# Altium project Main_Board.PrjPcb (part 15 of 44)
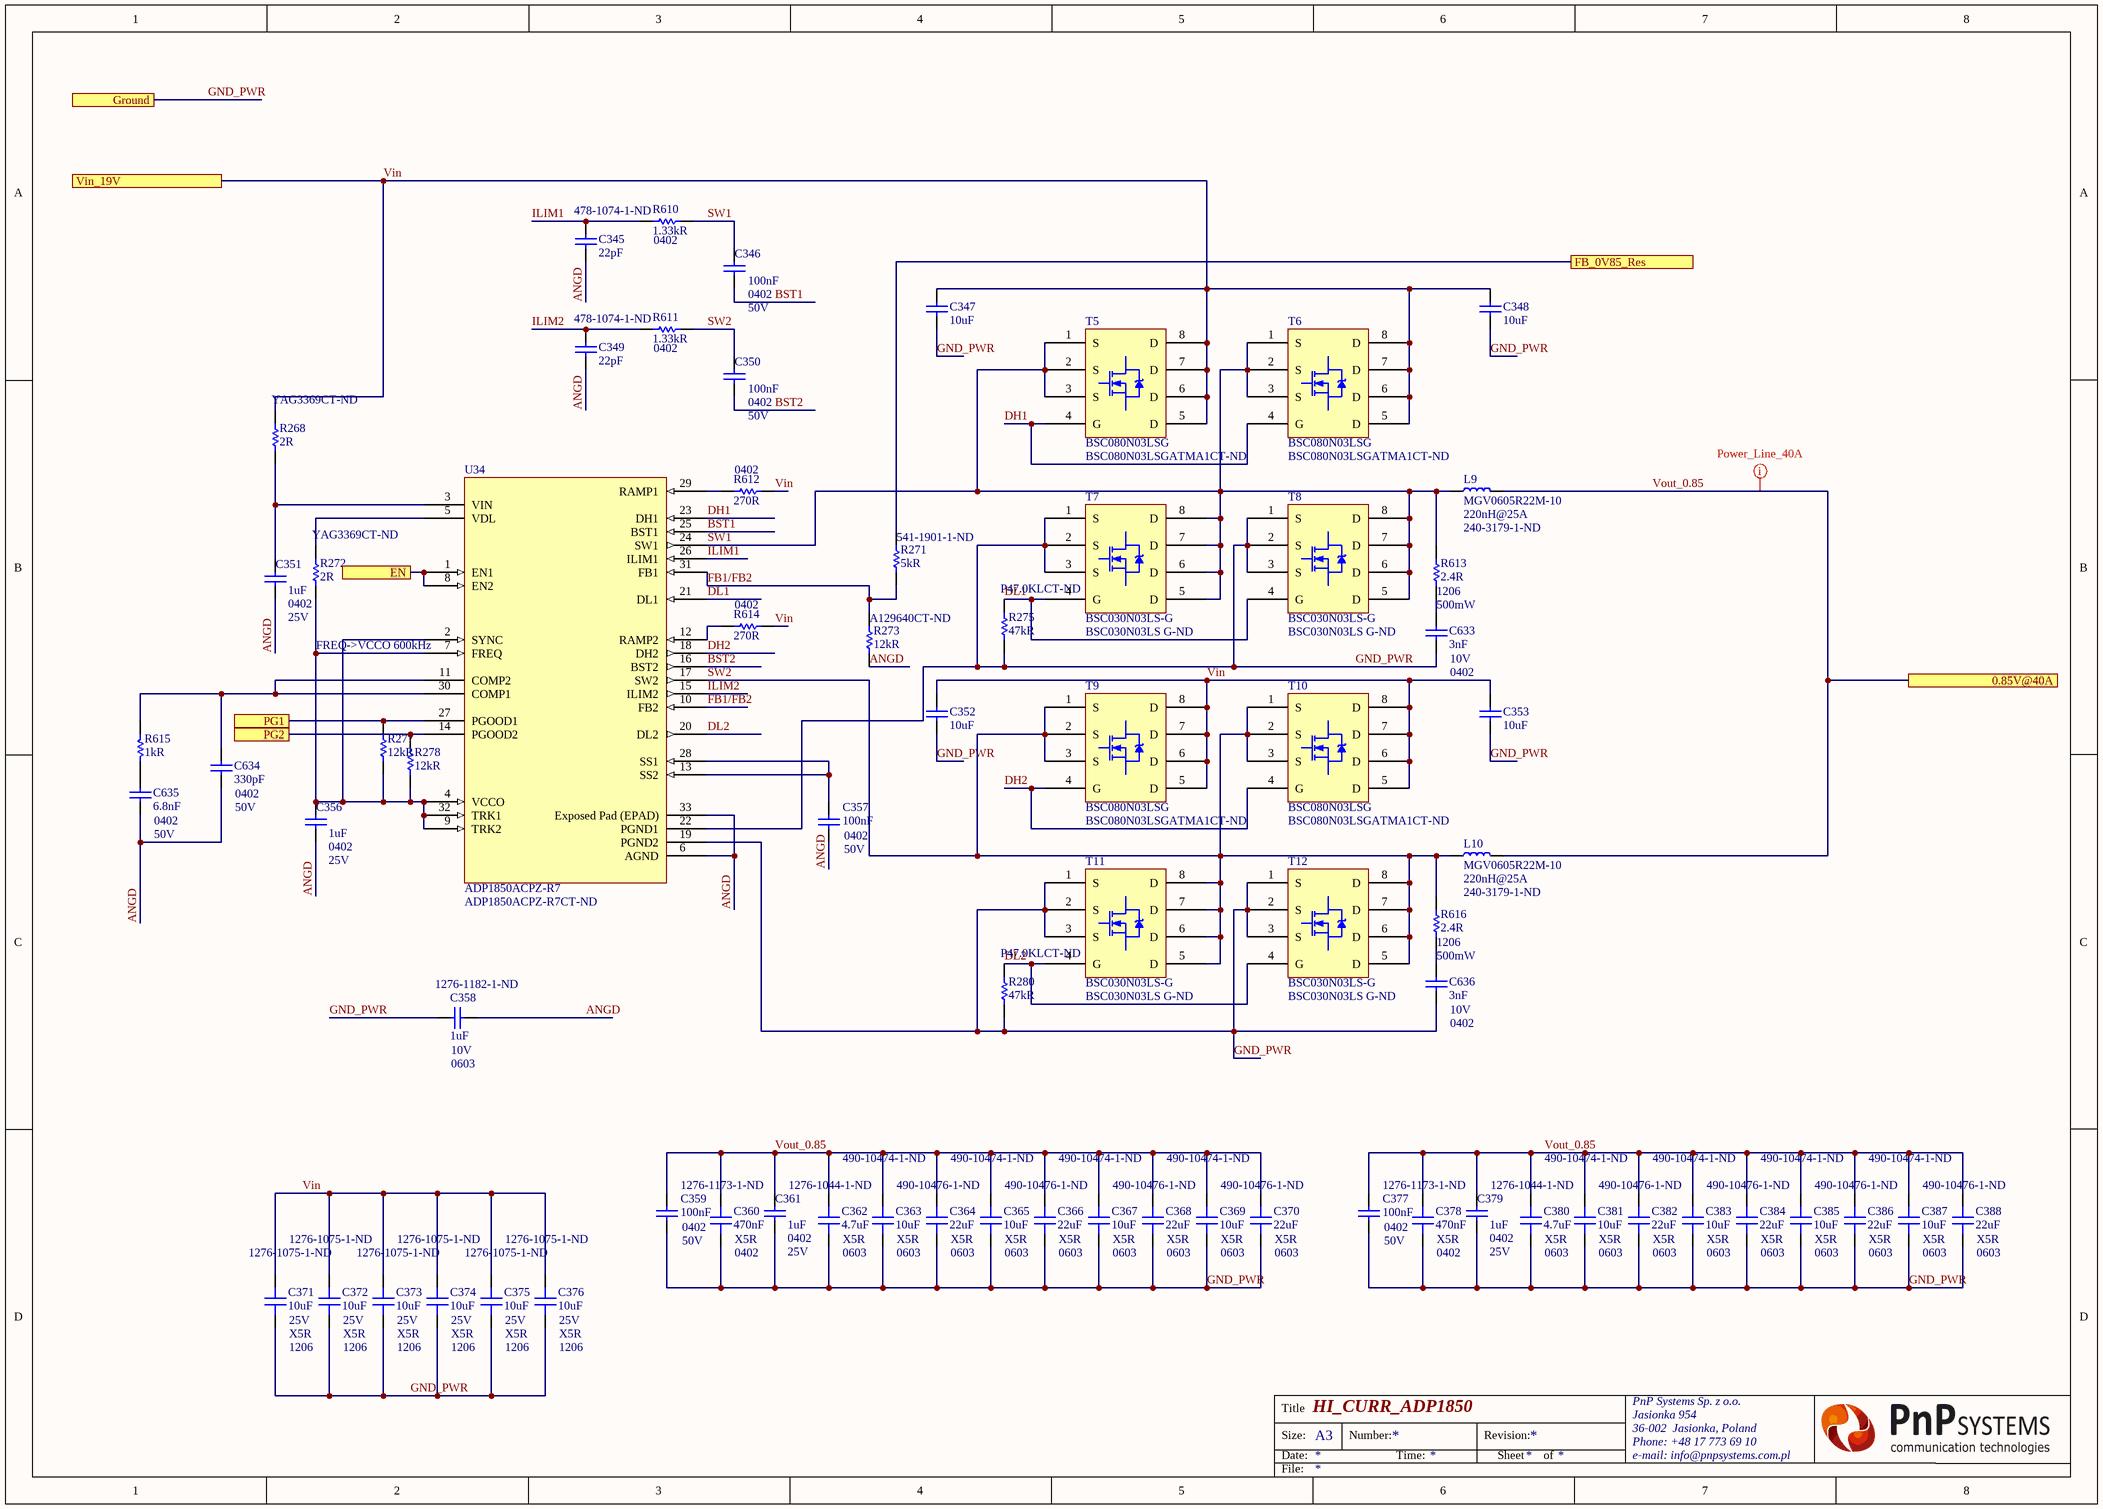
[diagram p126: HI_Curr_ADP1850.SchDoc]

## Sheet HI_Curr_ADP1850.SchDoc: HI_CURR_ADP1850 (continued)

### Library data of the parts
C345 C349 = Capacitor: Manufacturer: Kyocera AVX; Manufacturer Part Number: 04025A220JAT2A; Tolerance: 5%; Voltage Rating: 50V; Dielectric: C0G; Temperature Coefficient: 30ppm/°C; Supplier 1: Digi-Key; Stock 1: 1489814; Pricing 1: 1 = 0,10000, 10 = 0,03500, 100 = 0,01550, 500 = 0,01108, 1000 = 0,00871, 2500 = 0,00792, 5000 = 0,00729 (USD); RoHS: Yes; Mount: Surface Mount; Case/Package: 0402; Number of Pins: 2; Case Code (Metric): 1005; Case Code (Imperial): 0402; Contact Plating: Tin,Matte; Min Operating Temperature: -55°C; Max Operating Temperature: 125°C; Capacitance: 22pF; Packaging: Tape and Reel; Voltage Rating (DC): 50V; Package Quantity: 1; Termination: SMD/SMT; Voltage: 50V; Length: 1mm; Height: 0.5mm; Width: 0.02inch; Depth: 0.5mm; Thickness: 0.022inch; Radiation Hardening: No; Lead Free: Lead Free; REACH SVHC: No SVHC; ComponentLink1URL: https://datasheet.ciiva.com/11787/0900766b80def0e2-11787300.pdf?src-supplier=RSComponents; ComponentLink1Description: https://datasheet.ciiva.com/11787/0900766b80def0e2-11787300.pdf?src-supplier=RSComponents; ComponentLink2URL: https://datasheet.ciiva.com/39121/2009578-39121644.pdf?src-supplier=Jameco; ComponentLink2Description: https://datasheet.ciiva.com/39121/2009578-39121644.pdf?src-supplier=Jameco; ComponentLink3URL: https://datasheet.ciiva.com/1123/ccog-1123585.pdf?src-supplier=Element14; ComponentLink3Description: https://datasheet.ciiva.com/1123/ccog-1123585.pdf?src-supplier=Element14; ComponentLink4URL: https://datasheet.ciiva.com/1123/ccog-1123586.pdf?src-supplier=Element14; ComponentLink4Description: https://datasheet.ciiva.com/1123/ccog-1123586.pdf?src-supplier=Element14; ComponentLink5URL: https://datasheet.ciiva.com/150/ccog-150515.pdf?src-supplier=Digi-Key; ComponentLink5Description: https://datasheet.ciiva.com/150/ccog-150515.pdf?src-supplier=Digi-Key; ComponentLink6URL: https://datasheet.ciiva.com/150/ccog-150516.pdf?src-supplier=Digi-Key; ComponentLink6Description: https://datasheet.ciiva.com/150/ccog-150516.pdf?src-supplier=Digi-Key; ComponentLink7URL: https://datasheet.ciiva.com/150/ccog-150517.pdf?src-supplier=Digi-Key; ComponentLink7Description: https://datasheet.ciiva.com/150/ccog-150517.pdf?src-supplier=Digi-Key; ComponentLink8URL: https://datasheet.ciiva.com/2987/ccog-2987653.pdf?src-supplier=Avnet; ComponentLink8Description: https://datasheet.ciiva.com/2987/ccog-2987653.pdf?src-supplier=Avnet; ComponentLink9URL: https://datasheet.ciiva.com/2987/ccog-2987654.pdf?src-supplier=Avnet; ComponentLink9Description: https://datasheet.ciiva.com/2987/ccog-2987654.pdf?src-supplier=Avnet; ComponentLink10URL: https://datasheet.ciiva.com/5423/ccog-243403-5423927.pdf?src-supplier=Mouser; ComponentLink10Description: https://datasheet.ciiva.com/5423/ccog-243403-5423927.pdf?src-supplier=Mouser; ComponentLink11URL: https://datasheet.ciiva.com/16218/ccog-16218185.pdf?src-supplier=Future+Electronics; ComponentLink11Description: https://datasheet.ciiva.com/16218/ccog-16218185.pdf?src-supplier=Future+Electronics; ComponentLink12URL: https://datasheet.ciiva.com/28592/759117-28592746.pdf?src-supplier=Element14; ComponentLink12Description: https://datasheet.ciiva.com/28592/759117-28592746.pdf?src-supplier=Element14; ComponentLink13URL: https://datasheet.ciiva.com/15165/getdatasheetpartid-38041-15165131.pdf?src-supplier=Verical; ComponentLink13Description: https://datasheet.ciiva.com/15165/getdatasheetpartid-38041-15165131.pdf?src-supplier=Verical
C346 C350 C357 C359 C377 = Capacitor: CAP CER 0.1UF 50V X5R 0402; Manufacturer: Murata; Manufacturer Part Number: GRM155R61H104KE14D; Dielectric Material: Ceramic; Dissipation Factor: 0.025%; Tolerance: 10%; Supplier 1: Digi-Key; Supplier Part Number 1: 490-10697-1-ND; RoHS: Yes; Category: Ceramic Capacitors; Stock 1: 435607; Pricing 1: 1=0,10000, 10=0,04600, 100=0,02050, 500=0,01464, 1000=0,01150, 2500=0,01045, 5000=0,00961 (USD); Mount: Surface Mount; Case/Package: 0402; Weight: 0.000212oz; Case Code (Metric): 1005; Min Operating Temperature: -55°C; Max Operating Temperature: 85°C; Capacitance: 100nF; Packaging: Tape and Reel; Voltage Rating: 50V; Dielectric: X5R; Termination: SMD/SMT; Composition: Ceramic; Voltage Rating (DC): 50V; Package Quantity: 10000; Length: 1mm; Height: 0.5mm; Width: 0.02inch; Thickness: 0.022inch; Depth: 0.5mm; REACH SVHC: No SVHC; Lead Free: Lead Free; ComponentLink1URL: http://www.farnell.com/datasheets/2079150.pdf?src-supplier=Farnell; ComponentLink1Description: http://www.farnell.com/datasheets/2079150.pdf?src-supplier=Farnell; ComponentLink2URL: http://www.mouser.com/ds/2/281/c02e-2905.pdf?src-supplier=Mouser; ComponentLink2Description: http://www.mouser.com/ds/2/281/c02e-2905.pdf?src-supplier=Mouser; ComponentLink3URL: http://www.farnell.com/datasheets/2079150.pdf?src-supplier=Element14; ComponentLink3Description: http://www.farnell.com/datasheets/2079150.pdf?src-supplier=Element14; ComponentLink4URL: http://search.murata.co.jp/Ceramy/image/img/A01X/G101/ENG/GRM155R61H104KE14-01.pdf?src-supplier=Digi-Key; ComponentLink4Description: http://search.murata.co.jp/Ceramy/image/img/A01X/G101/ENG/GRM155R61H104KE14-01.pdf?src-supplier=Digi-Key
C347 C348 C352 C353 = Capacitor: Manufacturer 1: Murata; Manufacturer Part Number 1: GRM31CR71E106MA12L; Tolerance: 20%; Dielectric: X7R; Voltage Rating: 25V; Supplier 1: Digi-Key; Supplier Part Number 1: 490-6519-1-ND; Stock 1: 9864; Pricing 1: 1=0,79000, 10=0,59800, 100=0,42750, 500=0,33098, 1000=0,28501 (USD); RoHS: Yes; Mount: Surface Mount; Case/Package: 1206; Case Code (Metric): 3216; Case Code (Imperial): 1206; Min Operating Temperature: -55°C; Max Operating Temperature: 125°C; Capacitance: 10uF; Package Quantity: 1; Packaging: Tape and Reel; Termination: SMD/SMT; Voltage: 25V; Voltage Rating (DC): 25V; Length: 3.2mm; Height: 1.6mm; Width: 0.063inch; Thickness: 0.071inch; Depth: 1.6mm; Radiation Hardening: No; REACH SVHC: No SVHC; Lead Free: Lead Free; ComponentLink1URL: https://datasheet.ciiva.com/11607/product-11607561.pdf?src-supplier=Avnet; ComponentLink1Description: https://datasheet.ciiva.com/11607/product-11607561.pdf?src-supplier=Avnet; ComponentLink2URL: https://datasheet.ciiva.com/5412/product-5412861.pdf?src-supplier=Mouser; ComponentLink2Description: https://datasheet.ciiva.com/5412/product-5412861.pdf?src-supplier=Mouser; ComponentLink3URL: https://datasheet.ciiva.com/6264/partnumbering-e-01-6264463.pdf?src-supplier=Digi-Key; ComponentLink3Description: https://datasheet.ciiva.com/6264/partnumbering-e-01-6264463.pdf?src-supplier=Digi-Key
C351 C356 C361 C379 = Capacitor: as C331 on sheet Power_Hi_Curr; Supplier 1: Digi-Key; Supplier Part Number 1: 490-12263-1-ND; Manufacturer: Murata; Manufacturer Part Number: GRT155R61E105KE01D; RoHS: Yes; Category: Ceramic Capacitors; Stock 1: 341453; Pricing 1: 1=0,18000, 10=0,12300, 100=0,06210, 500=0,04248, 1000=0,03758, 2500=0,03594, 5000=0,03268 (USD); Mount: Surface Mount; Case Code (Metric): 1005; Case Code (Imperial): 0402; Min Operating Temperature: -55°C; Max Operating Temperature: 85°C; Packaging: Tape and Reel; Capacitance: 1uF; Tolerance: 10%; Dielectric: X5R; Voltage Rating (DC): 25V; Length: 0.039inch; Width: 0.02inch; Thickness: 0.022inch; Ratings: AEC-Q200; ComponentLink1URL: http://www.farnell.com/datasheets/2165918.pdf?src-supplier=Farnell; ComponentLink1Description: http://www.farnell.com/datasheets/2165918.pdf?src-supplier=Farnell; ComponentLink2URL: http://search.murata.co.jp/Ceramy/image/img/A01X/G101/ENG/GRT155R61E105KE01-01.pdf?src-supplier=Digi-Key; ComponentLink2Description: http://search.murata.co.jp/Ceramy/image/img/A01X/G101/ENG/GRT155R61E105KE01-01.pdf?src-supplier=Digi-Key; ComponentLink3URL: http://www.farnell.com/datasheets/2165918.pdf?src-supplier=Element14; ComponentLink3Description: http://www.farnell.com/datasheets/2165918.pdf?src-supplier=Element14
C358 = Capacitor: Cap Ceramic 1uF 10V X5R 10% SMD 0603 85C Paper T/R; Manufacturer: Samsung; Manufacturer Part Number: CL10A105KP8NNNC; Supplier 1: Digi-Key; RoHS: Yes; Category: Ceramic Capacitors; Stock 1: 3646234; Pricing 1: 1=0,10000, 10=0,03600, 100=0,01610, 500=0,01152, 1000=0,00905 (USD); Mount: Surface Mount; Case Code (Metric): 1608; Case Code (Imperial): 0603; Contact Plating: Tin; Min Operating Temperature: -55°C; Max Operating Temperature: 85°C; Tolerance: 10%; Packaging: Tape and Reel; Package Quantity: 1; Capacitance: 1uF; Dielectric: X5R; Voltage: 10V; Length: 1.6mm; Height: 0.8mm; Width: 0.031inch; Thickness: 0.035inch; Depth: 0.8mm; Radiation Hardening: No; ComponentLink1URL: https://datasheet.ciiva.com/15195/getdatasheetpartid-358616-15195708.pdf?src-supplier=Verical; ComponentLink1Description: https://datasheet.ciiva.com/15195/getdatasheetpartid-358616-15195708.pdf?src-supplier=Verical; ComponentLink2URL: https://datasheet.ciiva.com/16358/cl05b104kq5nnnc-16358431.pdf?src-supplier=Future+Electronics; ComponentLink2Description: https://datasheet.ciiva.com/16358/cl05b104kq5nnnc-16358431.pdf?src-supplier=Future+Electronics
C360 C378 = Capacitor: Manufacturer: Samsung; Manufacturer Part Number: CL05A474KP5NNNC; Tolerance: 10%; Voltage Rating: 10V; Supplier 1: Digi-Key; Stock 1: 941442; Pricing 1: 1 = 0,10000, 10 = 0,07000, 100 = 0,03140, 500 = 0,02240, 1000 = 0,01761, 2500 = 0,01600, 5000 = 0,01472 (USD); RoHS: Yes; Mount: Surface Mount; Case Code (Metric): 1005; Case Code (Imperial): 0402; Min Operating Temperature: -55°C; Max Operating Temperature: 85°C; Capacitance: 470nF; Packaging: Tape and Reel; Voltage Rating (DC): 10V; Length: 1mm; Height: 0.5mm; Width: 0.02inch; Thickness: 0.022inch; Depth: 0.5mm; Radiation Hardening: No; Lead Free: Lead Free; ComponentLink1URL: https://datasheet.ciiva.com/25710/cl05a474kp5nnnc-25710324.pdf?src-supplier=Digi-Key; ComponentLink1Description: https://datasheet.ciiva.com/25710/cl05a474kp5nnnc-25710324.pdf?src-supplier=Digi-Key; ComponentLink2URL: https://datasheet.ciiva.com/26838/getdatasheetpartid-355286-26838191.pdf?src-supplier=Verical; ComponentLink2Description: https://datasheet.ciiva.com/26838/getdatasheetpartid-355286-26838191.pdf?src-supplier=Verical; ComponentLink3URL: https://datasheet.ciiva.com/16437/cl05b104kq5nnnc-16437351.pdf?src-supplier=Future+Electronics; ComponentLink3Description: https://datasheet.ciiva.com/16437/cl05b104kq5nnnc-16437351.pdf?src-supplier=Future+Electronics
C362 C380 = Capacitor: Manufacturer: Samsung; Manufacturer Part Number: CL10A475KP8NNNC; Tolerance: 10%; Voltage Rating: 10V; Supplier 1: Digi-Key; Stock 1: 2124648; Pricing 1: 1 = 0,13000, 10 = 0,09600, 100 = 0,04520, 500 = 0,03168, 1000 = 0,02622 (USD); RoHS: Yes; Mount: Surface Mount; Case Code (Metric): 1608; Case Code (Imperial): 0603; Contact Plating: Tin; Min Operating Temperature: -55°C; Max Operating Temperature: 85°C; Capacitance: 4.7uF; Package Quantity: 1; Packaging: Tape and Reel; Length: 1.6mm; Height: 0.8mm; Width: 0.031inch; Thickness: 0.035inch; Depth: 0.8mm; Radiation Hardening: No; ComponentLink1URL: https://datasheet.ciiva.com/25797/cl10a475kp8nnnc-25797520.pdf?src-supplier=Digi-Key; ComponentLink1Description: https://datasheet.ciiva.com/25797/cl10a475kp8nnnc-25797520.pdf?src-supplier=Digi-Key; ComponentLink2URL: https://datasheet.ciiva.com/26838/getdatasheetpartid-358676-26838384.pdf?src-supplier=Verical; ComponentLink2Description: https://datasheet.ciiva.com/26838/getdatasheetpartid-358676-26838384.pdf?src-supplier=Verical; ComponentLink3URL: https://datasheet.ciiva.com/16318/cl05b104kq5nnnc-16318245.pdf?src-supplier=Future+Electronics; ComponentLink3Description: https://datasheet.ciiva.com/16318/cl05b104kq5nnnc-16318245.pdf?src-supplier=Future+Electronics
C363 C365 C367 C369 C381 C383 C385 C387 = Capacitor: Manufacturer: Murata; Manufacturer Part Number: GRM188R61A106KE69D; Tolerance: 10%; Voltage Rating: 10V; Supplier 1: Digi-Key; Stock 1: 4597169; Pricing 1: 1 = 0,21000, 10 = 0,14000, 100 = 0,07110, 500 = 0,04864, 1000 = 0,04303 (USD); RoHS: Yes; Mount: Surface Mount; Case Code (Metric): 1608; Case Code (Imperial): 0603; Min Operating Temperature: -55°C; Max Operating Temperature: 85°C; Capacitance: 10uF; Packaging: Tape and Reel; Voltage: 10V; Voltage Rating (DC): 10V; Length: 1.6mm; Height: 0.8mm; Width: 0.031inch; Thickness: 0.037inch; Depth: 0.8mm; REACH SVHC: No SVHC; Lead Free: Lead Free; ComponentLink1URL: http://components.arrow.com/part/dataview/0323_07281717?src-supplier=Arrow+Europe; ComponentLink1Description: http://components.arrow.com/part/dataview/0323_07281717?src-supplier=Arrow+Europe; ComponentLink2URL: http://www.farnell.com/datasheets/1955682.pdf?src-supplier=Farnell; ComponentLink2Description: http://www.farnell.com/datasheets/1955682.pdf?src-supplier=Farnell; ComponentLink3URL: http://www.mouser.com/ds/2/281/c02e-2905.pdf?src-supplier=Mouser; ComponentLink3Description: http://www.mouser.com/ds/2/281/c02e-2905.pdf?src-supplier=Mouser; ComponentLink4URL: http://search.murata.co.jp/Ceramy/image/img/A01X/G101/ENG/GRM188R61A106KE69-01.pdf?src-supplier=Digi-Key; ComponentLink4Description: http://search.murata.co.jp/Ceramy/image/img/A01X/G101/ENG/GRM188R61A106KE69-01.pdf?src-supplier=Digi-Key; ComponentLink5URL: http://www.farnell.com/datasheets/1955682.pdf?src-supplier=Element14; ComponentLink5Description: http://www.farnell.com/datasheets/1955682.pdf?src-supplier=Element14; ComponentLink6URL: http://www.farnell.com/datasheets/1955682.pdf?src-supplier=Newark; ComponentLink6Description: http://www.farnell.com/datasheets/1955682.pdf?src-supplier=Newark; ComponentLink7URL: http://psearch.en.murata.com/capacitor/product/GRM188R61A106KE69%23.pdf?src-supplier=Avnet; ComponentLink7Description: http://psearch.en.murata.com/capacitor/product/GRM188R61A106KE69%23.pdf?src-supplier=Avnet
C364 C366 C368 C370 C382 C384 C386 C388 = Capacitor: Manufacturer: Murata; Manufacturer Part Number: GRM188R61A226ME15D; Material: Ceramic; Tolerance: 20%; Voltage Rating: 10V; Supplier 1: Digi-Key; Stock 1: 1768748; Pricing 1: 1 = 0,31000, 10 = 0,21500, 100 = 0,12160, 500 = 0,08584, 1000 = 0,07512 (USD); RoHS: Yes; Mount: Surface Mount; Weight: 0.000222oz; Case Code (Metric): 1608; Case Code (Imperial): 0603; Min Operating Temperature: -55°C; Max Operating Temperature: 85°C; Capacitance: 22uF; Packaging: Tape and Reel; Termination: SMD/SMT; Voltage Rating (DC): 10V; Package Quantity: 4000; Length: 1.6mm; Height: 0.8mm; Width: 0.8mm; Thickness: 0.039inch; Depth: 0.8mm; REACH SVHC: No SVHC; Lead Free: Lead Free; ComponentLink1URL: https://datasheet.ciiva.com/46444/1769893-46444975.pdf?src-supplier=Element14; ComponentLink1Description: https://datasheet.ciiva.com/46444/1769893-46444975.pdf?src-supplier=Element14
C371-C376 = Capacitor: Cap Ceramic 10uF 25V X5R 10% SMD 1206 85C Embossed T/R; Manufacturer: Samsung; Manufacturer Part Number: CL31A106KAHNNNE; Supplier 1: Digi-Key; RoHS: Yes; Category: Ceramic Capacitors; Stock 1: 791813; Pricing 1: 1=0,22000, 10=0,15000, 100=0,07600, 500=0,05200, 1000=0,04600 (USD); Mount: Surface Mount; Case Code (Metric): 3216; Case Code (Imperial): 1206; Material: Ceramic; Contact Plating: Tin; Min Operating Temperature: -55°C; Max Operating Temperature: 85°C; Tolerance: 10%; Capacitance: 10uF; Voltage Rating (DC): 25V; Packaging: Tape and Reel; Voltage Rating: 25V; Length: 3.2mm; Height: 1.6mm; Depth: 1.6mm; Width: 0.063inch; Thickness: 0.071inch; Radiation Hardening: No; Lead Free: Lead Free; ComponentLink1URL: https://datasheet.ciiva.com/25710/cl31a106kahnnne-25710837.pdf?src-supplier=Digi-Key; ComponentLink1Description: https://datasheet.ciiva.com/25710/cl31a106kahnnne-25710837.pdf?src-supplier=Digi-Key; ComponentLink2URL: https://datasheet.ciiva.com/15195/getdatasheetpartid-355210-15195990.pdf?src-supplier=Verical; ComponentLink2Description: https://datasheet.ciiva.com/15195/getdatasheetpartid-355210-15195990.pdf?src-supplier=Verical; ComponentLink3URL: https://datasheet.ciiva.com/29201/452519-da-01-en-vs-kondensator-1206-29201124.pdf?src-supplier=Conrad; ComponentLink3Description: https://datasheet.ciiva.com/29201/452519-da-01-en-vs-kondensator-1206-29201124.pdf?src-supplier=Conrad
C633 C636 = Capacitor: Manufacturer: Murata; Manufacturer Part Number: GRM1557U1A302JA01D; Tolerance: 5%; Dielectric: U2J; Supplier 1: Digi-Key; Supplier Part Number 1: 490-8243-1-ND; Stock 1: 13189; Pricing 1: 1 = 0,22000, 10 = 0,14700, 100 = 0,07450, 500 = 0,05100, 1000 = 0,04511, 2500 = 0,04315, 5000 = 0,03923 (USD); RoHS: Yes; Mount: Surface Mount; Case/Package: 0402; Case Code (Metric): 1005; Min Operating Temperature: -55°C; Max Operating Temperature: 125°C; Capacitance: 3nF; Packaging: Tape and Reel; Voltage Rating (DC): 10V; Package Quantity: 10000; Termination: SMD/SMT; Length: 1mm; Height: 0.5mm; Width: 0.5mm; Thickness: 0.022inch; Depth: 0.5mm; Radiation Hardening: No; Lead Free: Lead Free; ComponentLink1URL: https://datasheet.ciiva.com/11620/product-11620441.pdf?src-supplier=Avnet; ComponentLink1Description: https://datasheet.ciiva.com/11620/product-11620441.pdf?src-supplier=Avnet; ComponentLink2URL: https://datasheet.ciiva.com/29542/partnumbering-e-01-29542685.pdf?src-supplier=Digi-Key; ComponentLink2Description: https://datasheet.ciiva.com/29542/partnumbering-e-01-29542685.pdf?src-supplier=Digi-Key; ComponentLink3URL: https://datasheet.ciiva.com/29542/partnumbering-e-01-29542686.pdf?src-supplier=Digi-Key; ComponentLink3Description: https://datasheet.ciiva.com/29542/partnumbering-e-01-29542686.pdf?src-supplier=Digi-Key; ComponentLink4URL: https://datasheet.ciiva.com/29542/partnumbering-e-01-29542687.pdf?src-supplier=Digi-Key; ComponentLink4Description: https://datasheet.ciiva.com/29542/partnumbering-e-01-29542687.pdf?src-supplier=Digi-Key
C634 = Capacitor: Manufacturer: Yageo; Manufacturer Part Number: CC0402KRX7R9BB331; Dielectric Material: Ceramic; Tolerance: 10%; Dielectric: X7R; Insulation Resistance: 100GR; Supplier 1: Digi-Key; Supplier Part Number 1: 311-1027-1-ND; Stock 1: 223776; Pricing 1: 1 = 0,10000, 10 = 0,03000, 100 = 0,01350, 500 = 0,00966, 1000 = 0,00759, 2500 = 0,00690, 5000 = 0,00635 (USD); RoHS: Yes; Mount: Surface Mount; Case/Package: 0402; Case Code (Metric): 1005; Min Operating Temperature: -55°C; Max Operating Temperature: 125°C; Capacitance: 330pF; Packaging: Tape and Reel; Voltage Rating (DC): 50V; Package Quantity: 1; Termination: SMD/SMT; Composition: Ceramic; Length: 1mm; Height: 0.5mm; Width: 0.5mm; Thickness: 0.022inch; Depth: 0.5mm; Radiation Hardening: No; REACH SVHC: No SVHC; Lead Free: Lead Free; Halogen Free: Halogen Free; ComponentLink1URL: https://datasheet.ciiva.com/143/mlccorderingcode-143965.pdf?src-supplier=Digi-Key; ComponentLink1Description: https://datasheet.ciiva.com/143/mlccorderingcode-143965.pdf?src-supplier=Digi-Key; ComponentLink2URL: https://datasheet.ciiva.com/143/mlccorderingcode-143966.pdf?src-supplier=Digi-Key; ComponentLink2Description: https://datasheet.ciiva.com/143/mlccorderingcode-143966.pdf?src-supplier=Digi-Key; ComponentLink3URL: https://datasheet.ciiva.com/143/mlccorderingcode-143967.pdf?src-supplier=Digi-Key; ComponentLink3Description: https://datasheet.ciiva.com/143/mlccorderingcode-143967.pdf?src-supplier=Digi-Key; ComponentLink4URL: https://datasheet.ciiva.com/7978/1489800-7978101.pdf?src-supplier=Element14; ComponentLink4Description: https://datasheet.ciiva.com/7978/1489800-7978101.pdf?src-supplier=Element14; ComponentLink5URL: https://datasheet.ciiva.com/5425/upy-gphc-x7r-6-3v-to-50v-8-5425451.pdf?src-supplier=Mouser; ComponentLink5Description: https://datasheet.ciiva.com/5425/upy-gphc-x7r-6-3v-to-50v-8-5425451.pdf?src-supplier=Mouser; ComponentLink6URL: https://datasheet.ciiva.com/8033/1489800-8033628.pdf?src-supplier=Element14; ComponentLink6Description: https://datasheet.ciiva.com/8033/1489800-8033628.pdf?src-supplier=Element14; ComponentLink7URL: https://datasheet.ciiva.com/11464/upy-gphc-x7r-6-3v-to-50v-8-11464908.pdf?src-supplier=Avnet; ComponentLink7Description: https://datasheet.ciiva.com/11464/upy-gphc-x7r-6-3v-to-50v-8-11464908.pdf?src-supplier=Avnet; ComponentLink8URL: https://datasheet.ciiva.com/46394/1489800-46394572.pdf?src-supplier=Element14; ComponentLink8Description: https://datasheet.ciiva.com/46394/1489800-46394572.pdf?src-supplier=Element14; ComponentLink9URL: https://datasheet.ciiva.com/8033/1489800-8033629.pdf?src-supplier=Element14; ComponentLink9Description: https://datasheet.ciiva.com/8033/1489800-8033629.pdf?src-supplier=Element14
C635 = Capacitor: Manufacturer: Yageo; Manufacturer Part Number: CC0402KRX7R9BB682; Tolerance: 10%; Dielectric: X7R; Supplier 1: Digi-Key; Supplier Part Number 1: 311-1726-1-ND; Stock 1: 116423; Pricing 1: 1 = 0,10000, 10 = 0,03000, 100 = 0,01350, 500 = 0,00966, 1000 = 0,00759, 2500 = 0,00690, 5000 = 0,00635 (USD); RoHS: Yes; Mount: Surface Mount; Case/Package: 0402; Number of Pins: 2; Weight: 2.3E-05oz; Case Code (Metric): 1005; Min Operating Temperature: -55°C; Max Operating Temperature: 125°C; Capacitance: 6.8nF; Packaging: Tape and Reel; Voltage Rating: 50V; Voltage Rating (DC): 50V; Termination: SMD/SMT; Composition: Ceramic; Length: 1mm; Height: 0.5mm; Width: 0.02inch; Thickness: 0.022inch; Depth: 0.5mm; Radiation Hardening: No; Lead Free: Lead Free; Halogen Free: Halogen Free; ComponentLink1URL: https://datasheet.ciiva.com/11786/0900766b8079c870-11786013.pdf?src-supplier=RSComponents; ComponentLink1Description: https://datasheet.ciiva.com/11786/0900766b8079c870-11786013.pdf?src-supplier=RSComponents; ComponentLink2URL: https://datasheet.ciiva.com/17437/upy-gphc-x7r-6-3v-to-50v-8-17437372.pdf?src-supplier=Avnet+Europe; ComponentLink2Description: https://datasheet.ciiva.com/17437/upy-gphc-x7r-6-3v-to-50v-8-17437372.pdf?src-supplier=Avnet+Europe; ComponentLink3URL: https://datasheet.ciiva.com/11466/upy-gphc-x7r-6-3v-to-50v-8-11466414.pdf?src-supplier=Avnet; ComponentLink3Description: https://datasheet.ciiva.com/11466/upy-gphc-x7r-6-3v-to-50v-8-11466414.pdf?src-supplier=Avnet; ComponentLink4URL: https://datasheet.ciiva.com/13208/upy-gphc-x7r-6-3v-to-50v-8-12304-13208543.pdf?src-supplier=Mouser; ComponentLink4Description: https://datasheet.ciiva.com/13208/upy-gphc-x7r-6-3v-to-50v-8-12304-13208543.pdf?src-supplier=Mouser
L9 L10 = MGV0605R22M-10: 220nH Shielded Molded Inductor 25A 1.9mOhm Max Nonstandard; Manufacturer 1: Laird; Supplier 1: Digi-Key; Manufacturer Part Number 1: MGV0605R22M-10; Stock 1: 1560; Pricing 1: 1=0,92000, 10=0,85800, 100=0,62020 (USD); RoHS: No; ComponentLink1Description: Datasheet MGV0605 Series; ComponentLink1URL: https://assets.lairdtech.com/home/brandworld/files/MGV0605%20series%20approve%20sheet.pdf
R268 R272 = Resistor: Manufacturer 1: Yageo; Manufacturer Part Number 1: RC0402FR-072RL; Power Rating: 63mW; Tolerance: 1%; Voltage Rating: 50V; Temperature Coefficient: 200ppm/°C; Supplier 1: Digi-Key; Stock 1: 417064; Pricing 1: 1=0,10000, 10=0,02400, 100=0,00970, 1000=0,00435, 2500=0,00377, 5000=0,00312 (USD); RoHS: Yes; Case/Package: 0402; Case Code (Imperial): 0402; Case Code (Metric): 1005; Contact Plating: Tin,Matte; Min Operating Temperature: -55°C; Max Operating Temperature: 155°C; Resistance: 2R; Packaging: Tape and Reel; Composition: Thick Film; Termination: SMD/SMT; Number of Terminations: 2; Military Standard: Not; Max Power Dissipation: 63mW; Voltage Rating (DC): 50V; Features: Moisture Resistant; Length: 1mm; Height: 0.016inch; Width: 0.02inch; Depth: 0.5mm; REACH SVHC: Unknown; Lead Free: Lead Free; ComponentLink1URL: https://datasheet.ciiva.com/11808/0900766b80c66297-11808785.pdf?src-supplier=RSComponents; ComponentLink1Description: https://datasheet.ciiva.com/11808/0900766b80c66297-11808785.pdf?src-supplier=RSComponents; ComponentLink2URL: https://datasheet.ciiva.com/16868/pyu-rc0402-51-rohs-l-6-16868438.pdf?src-supplier=Avnet+Europe; ComponentLink2Description: https://datasheet.ciiva.com/16868/pyu-rc0402-51-rohs-l-6-16868438.pdf?src-supplier=Avnet+Europe; ComponentLink3URL: https://datasheet.ciiva.com/5596/pyu-rc0402-51-rohs-l-6-r-5596055.pdf?src-supplier=Mouser; ComponentLink3Description: https://datasheet.ciiva.com/5596/pyu-rc0402-51-rohs-l-6-r-5596055.pdf?src-supplier=Mouser; ComponentLink4URL: https://datasheet.ciiva.com/28415/pyu-rc0402-51-rohs-l-6-28415608.pdf?src-supplier=Avnet+Europe; ComponentLink4Description: https://datasheet.ciiva.com/28415/pyu-rc0402-51-rohs-l-6-28415608.pdf?src-supplier=Avnet+Europe; ComponentLink5URL: https://datasheet.ciiva.com/8894/pyu-rc0402-51-rohs-l-6-8894730.pdf?src-supplier=Avnet; ComponentLink5Description: https://datasheet.ciiva.com/8894/pyu-rc0402-51-rohs-l-6-8894730.pdf?src-supplier=Avnet; ComponentLink6URL: https://datasheet.ciiva.com/7849/1018594-7849950.pdf?src-supplier=Element14; ComponentLink6Description: https://datasheet.ciiva.com/7849/1018594-7849950.pdf?src-supplier=Element14; ComponentLink7URL: https://datasheet.ciiva.com/7849/1018594-7849951.pdf?src-supplier=Element14; ComponentLink7Description: https://datasheet.ciiva.com/7849/1018594-7849951.pdf?src-supplier=Element14
R271 = Resistor: RES SMD 5K OHM 0.1% 1/20W 0402; Manufacturer: Vishay Dale; Manufacturer Part Number: PNM0402E5001BST1; Max Power Dissipation: 50mW; Temperature Coefficient: 25ppm/°C; Supplier 1: Digi-Key; RoHS: Yes; Category: Chip SMD Resistors; Stock 1: 32246; Pricing 1: 1=1,08000, 10=0,95500, 100=0,69300 (USD); Case/Package: 0402; Case Code (Metric): 1005; Case Code (Imperial): 0402; Min Operating Temperature: -55°C; Max Operating Temperature: 155°C; Resistance: 5kR; Tolerance: 0.1%; Package Quantity: 1000; Packaging: Tape and Reel; Composition: Thin Film; Number of Terminations: 2; Features: Moisture Resistant,Anti-Sulfur; Length: 0.042inch; Height: 0.033inch; Width: 0.022inch; ComponentLink1URL: https://datasheet.ciiva.com/29717/pnm-29717416.pdf?src-supplier=Digi-Key; ComponentLink1Description: https://datasheet.ciiva.com/29717/pnm-29717416.pdf?src-supplier=Digi-Key; ComponentLink2URL: https://datasheet.ciiva.com/29717/pnm-29717417.pdf?src-supplier=Digi-Key; ComponentLink2Description: https://datasheet.ciiva.com/29717/pnm-29717417.pdf?src-supplier=Digi-Key; ComponentLink3URL: https://datasheet.ciiva.com/29717/pnm-29717418.pdf?src-supplier=Digi-Key; ComponentLink3Description: https://datasheet.ciiva.com/29717/pnm-29717418.pdf?src-supplier=Digi-Key
R273 R277 R278 = Resistor: CRGCQ 0402 12K 1%; Manufacturer: TE Connectivity; Manufacturer Part Number: CRGCQ0402F12K; Supplier 1: Digi-Key; RoHS: No; Stock 1: 103306; Pricing 1: 1=0,10000, 10=0,02100, 100=0,00860, 1000=0,00387, 2500=0,00336, 5000=0,00277 (USD); ComponentLink1URL: https://www.te.com/commerce/DocumentDelivery/DDEController?Action=srchrtrv&DocNm=1773204-3&DocType=DS&DocLang=English&src-supplier=Digi-Key; ComponentLink1Description: https://www.te.com/commerce/DocumentDelivery/DDEController?Action=srchrtrv&DocNm=1773204-3&DocType=DS&DocLang=English&src-supplier=Digi-Key; ComponentLink2URL: http://www.te.com/commerce/DocumentDelivery/DDEController?Action=srchrtrv&DocNm=1773204-3&DocType=DS&DocLang=English&src-supplier=Digi-Key; ComponentLink2Description: http://www.te.com/commerce/DocumentDelivery/DDEController?Action=srchrtrv&DocNm=1773204-3&DocType=DS&DocLang=English&src-supplier=Digi-Key; Resistance: 12kR
  R277 R278: Supplier Part Number 1: A129640CT-ND
R275 R280 = Resistor: PANASONIC - ERJ2RKF4702X - SMD Chip Resistor, 0402 [1005 Metric], 47 kohm, ERJ2R Series, 50 V, Thick Film, 100 mW; Manufacturer Part Number: ERJ-2RKF4702X; Voltage Rating: 50V; Power Rating: 100mW; Tolerance: 1%; Temperature Coefficient: 100ppm/°C; Supplier 1: Digi-Key; Manufacturer: Panasonic; RoHS: Yes; Category: Chip SMD Resistors; Stock 1: 1709999; Pricing 1: 1=0,10000, 10=0,04500, 100=0,01830, 1000=0,00822, 2500=0,00713, 5000=0,00589 (USD); Mount: Surface Mount; Case/Package: 0402; Number of Pins: 2; Case Code (Imperial): 0402; Case Code (Metric): 1005; Contact Plating: Tin; Min Operating Temperature: -55°C; Max Operating Temperature: 155°C; Packaging: Tape and Reel; Resistance: 47kR; Package Quantity: 1; Termination: SMD/SMT; Composition: Thick Film; Number of Terminations: 2; Military Standard: Not; Max Power Dissipation: 100mW; Voltage Rating (DC): 50V; Features: Automotive AEC-Q200; Length: 1mm; Height: 0.35mm; Width: 0.5mm; Depth: 0.5mm; Radiation Hardening: No; REACH SVHC: No SVHC; Lead Free: Lead Free; ComponentLink1URL: https://datasheet.ciiva.com/11821/0900766b80f80784-11821335.pdf?src-supplier=RSComponents; ComponentLink1Description: https://datasheet.ciiva.com/11821/0900766b80f80784-11821335.pdf?src-supplier=RSComponents; ComponentLink2URL: https://datasheet.ciiva.com/7802/426256-7802678.pdf?src-supplier=Element14; ComponentLink2Description: https://datasheet.ciiva.com/7802/426256-7802678.pdf?src-supplier=Element14; ComponentLink3URL: https://datasheet.ciiva.com/9189/aoa0000ce2-9189321.pdf?src-supplier=Avnet; ComponentLink3Description: https://datasheet.ciiva.com/9189/aoa0000ce2-9189321.pdf?src-supplier=Avnet; ComponentLink4URL: https://datasheet.ciiva.com/16514/aoa0000ce2-16514377.pdf?src-supplier=Avnet+Asia; ComponentLink4Description: https://datasheet.ciiva.com/16514/aoa0000ce2-16514377.pdf?src-supplier=Avnet+Asia; ComponentLink5URL: https://datasheet.ciiva.com/28587/1678782-28587161.pdf?src-supplier=Element14; ComponentLink5Description: https://datasheet.ciiva.com/28587/1678782-28587161.pdf?src-supplier=Element14; ComponentLink6URL: https://datasheet.ciiva.com/7802/aoa0000ce2-7802411.pdf?src-supplier=Element14; ComponentLink6Description: https://datasheet.ciiva.com/7802/aoa0000ce2-7802411.pdf?src-supplier=Element14; ComponentLink7URL: https://datasheet.ciiva.com/16769/70260748-16769387.pdf?src-supplier=Allied+Electronics; ComponentLink7Description: https://datasheet.ciiva.com/16769/70260748-16769387.pdf?src-supplier=Allied+Electronics; ComponentLink8URL: https://datasheet.ciiva.com/22668/1678782-22668316.pdf?src-supplier=Element14; ComponentLink8Description: https://datasheet.ciiva.com/22668/1678782-22668316.pdf?src-supplier=Element14; ComponentLink9URL: https://datasheet.ciiva.com/16770/70260748-16770349.pdf?src-supplier=Allied+Electronics; ComponentLink9Description: https://datasheet.ciiva.com/16770/70260748-16770349.pdf?src-supplier=Allied+Electronics; ComponentLink10URL: https://datasheet.ciiva.com/43467/1678782-43467455.pdf?src-supplier=Farnell; ComponentLink10Description: https://datasheet.ciiva.com/43467/1678782-43467455.pdf?src-supplier=Farnell; ComponentLink11URL: https://datasheet.ciiva.com/46372/1678782-46372853.pdf?src-supplier=Element14; ComponentLink11Description: https://datasheet.ciiva.com/46372/1678782-46372853.pdf?src-supplier=Element14
R610 R611 = Resistor: Manufacturer: Yageo; Manufacturer Part Number: RC0402FR-071K33L; Power Rating: 62.5mW; Tolerance: 1%; Voltage Rating: 50V; Temperature Coefficient: 100ppm/°C; Max Power Dissipation: 63mW; Supplier 1: Digi-Key; Supplier Part Number 1: 311-1.33KLRCT-ND; Stock 1: 189358; Pricing 1: 1 = 0,10000, 10 = 0,01600, 100 = 0,00640, 1000 = 0,00289, 2500 = 0,00251, 5000 = 0,00207 (USD); RoHS: Yes; Case/Package: 0402; Case Code (Metric): 1005; Contact Plating: Tin,Matte,Lead; Min Operating Temperature: -55°C; Max Operating Temperature: 155°C; Package Quantity: 1; Resistance: 1.33kR; Packaging: Tape and Reel; Composition: Thick Film; Number of Terminations: 2; Termination: SMD/SMT; Military Standard: Not; Features: Moisture Resistant; Length: 1mm; Height: 0.016inch; Width: 0.02inch; Depth: 0.5mm; Radiation Hardening: No; Lead Free: Lead Free; ComponentLink1URL: https://datasheet.ciiva.com/2508/pyu-r-int-thick-7-2508289.pdf?src-supplier=Digi-Key; ComponentLink1Description: https://datasheet.ciiva.com/2508/pyu-r-int-thick-7-2508289.pdf?src-supplier=Digi-Key; ComponentLink2URL: https://datasheet.ciiva.com/2508/pyu-r-int-thick-7-2508290.pdf?src-supplier=Digi-Key; ComponentLink2Description: https://datasheet.ciiva.com/2508/pyu-r-int-thick-7-2508290.pdf?src-supplier=Digi-Key; ComponentLink3URL: https://datasheet.ciiva.com/2508/pyu-r-int-thick-7-2508291.pdf?src-supplier=Digi-Key; ComponentLink3Description: https://datasheet.ciiva.com/2508/pyu-r-int-thick-7-2508291.pdf?src-supplier=Digi-Key; ComponentLink4URL: https://datasheet.ciiva.com/16856/pyu-rc0402-51-rohs-l-6-16856582.pdf?src-supplier=Avnet+Europe; ComponentLink4Description: https://datasheet.ciiva.com/16856/pyu-rc0402-51-rohs-l-6-16856582.pdf?src-supplier=Avnet+Europe; ComponentLink5URL: https://datasheet.ciiva.com/8895/pyu-rc0402-51-rohs-l-6-8895561.pdf?src-supplier=Avnet; ComponentLink5Description: https://datasheet.ciiva.com/8895/pyu-rc0402-51-rohs-l-6-8895561.pdf?src-supplier=Avnet; ComponentLink6URL: https://datasheet.ciiva.com/17423/pyu-rc0402-51-rohs-l-6-r-17423946.pdf?src-supplier=Future+Electronics; ComponentLink6Description: https://datasheet.ciiva.com/17423/pyu-rc0402-51-rohs-l-6-r-17423946.pdf?src-supplier=Future+Electronics; ComponentLink7URL: https://datasheet.ciiva.com/28417/pyu-rc0402-51-rohs-l-6-28417821.pdf?src-supplier=Avnet+Europe; ComponentLink7Description: https://datasheet.ciiva.com/28417/pyu-rc0402-51-rohs-l-6-28417821.pdf?src-supplier=Avnet+Europe
R612 R614 = Resistor: Manufacturer: Vishay BCcomponents; Manufacturer Part Number: MCS04020C2203FE000; Tolerance: 1%; Temperature Coefficient: 50ppm/°C; Supplier 1: Digi-Key; Supplier Part Number 1: 749-1566-1-ND; Stock 1: 29254; Pricing 1: 1 = 0,29000, 10 = 0,24200, 100 = 0,09460, 1000 = 0,03960, 2500 = 0,03630, 5000 = 0,03300 (USD); RoHS: Yes; Contact Plating: Tin; Min Operating Temperature: -55°C; Max Operating Temperature: 125°C; Packaging: Tape and Reel; Resistance: 270R; Composition: Thin Film; Military Standard: Not; Length: 1mm; Depth: 0.5mm; Width: 500um; Radiation Hardening: No; Lead Free: Lead Free; ComponentLink1URL: https://datasheet.ciiva.com/16892/mc-pro-16892747.pdf?src-supplier=Avnet+Europe; ComponentLink1Description: https://datasheet.ciiva.com/16892/mc-pro-16892747.pdf?src-supplier=Avnet+Europe
R613 R616 = Resistor: Manufacturer: Vishay Dale; Manufacturer Part Number: CRCW12062R40FKEAHP; Tolerance: 1%; Temperature Coefficient: 100ppm/°C; Supplier 1: Digi-Key; Supplier Part Number 1: 541-2.40UCT-ND; Stock 1: 24526; Pricing 1: 1 = 0,43000, 10 = 0,32600, 100 = 0,13720, 1000 = 0,07568, 2500 = 0,07095 (USD); RoHS: Yes; Case/Package: 1206; Case Code (Metric): 3216; Min Operating Temperature: -55°C; Max Operating Temperature: 155°C; Resistance: 2.4R; Packaging: Cut Tape; Composition: Thick Film; Number of Terminations: 2; Features: Automotive AEC-Q200; Length: 0.122inch; Height: 0.026inch; Width: 0.063inch; Lead Free: Lead Free; ComponentLink1URL: http://www.vishay.com/docs/20043/crcwhpe3.pdf?src-supplier=Digi-Key; ComponentLink1Description: http://www.vishay.com/docs/20043/crcwhpe3.pdf?src-supplier=Digi-Key
R615 = Resistor: as R14 on sheet Power_Hi_Curr; Supplier 1: Digi-Key; Supplier Part Number 1: P1.00KLDKR-ND; Manufacturer: Panasonic; Manufacturer Part Number: ERJ-2RKF1001X; RoHS: Yes; Category: Chip SMD Resistors; Stock 1: 1864188; Pricing 1: 1=0,10000, 10=0,04300, 100=0,01740, 1000=0,00782, 2500=0,00678, 5000=0,00561 (USD); Mount: Surface Mount; Case/Package: 0402; Number of Pins: 2; Contact Plating: Tin; Case Code (Imperial): 0402; Case Code (Metric): 1005; Min Operating Temperature: -55°C; Max Operating Temperature: 155°C; Composition: Thick Film; Resistance: 1kR; Termination: SMD/SMT; Number of Terminations: 2; Military Standard: Not; Features: Automotive AEC-Q200; Packaging: Tape and Reel; Voltage Rating: 50V; Package Quantity: 1; Max Power Dissipation: 100mW; Working Voltage: 50V; Length: 1mm; Height: 0.35mm; Depth: 0.5mm; Width: 0.5mm; Radiation Hardening: No; Lead Free: Lead Free; REACH SVHC: No SVHC; ComponentLink1URL: https://datasheet.ciiva.com/11821/0900766b80f80784-11821203.pdf?src-supplier=RSComponents; ComponentLink1Description: https://datasheet.ciiva.com/11821/0900766b80f80784-11821203.pdf?src-supplier=RSComponents; ComponentLink2URL: https://datasheet.ciiva.com/7942/aoa0000ce2-7942426.pdf?src-supplier=Element14; ComponentLink2Description: https://datasheet.ciiva.com/7942/aoa0000ce2-7942426.pdf?src-supplier=Element14; ComponentLink3URL: https://datasheet.ciiva.com/16523/aoa0000ce2-16523834.pdf?src-supplier=Avnet+Asia; ComponentLink3Description: https://datasheet.ciiva.com/16523/aoa0000ce2-16523834.pdf?src-supplier=Avnet+Asia; ComponentLink4URL: https://datasheet.ciiva.com/17215/aoa0000ce2-17215308.pdf?src-supplier=Avnet+Europe; ComponentLink4Description: https://datasheet.ciiva.com/17215/aoa0000ce2-17215308.pdf?src-supplier=Avnet+Europe; ComponentLink5URL: https://datasheet.ciiva.com/22673/1678782-22673916.pdf?src-supplier=Element14; ComponentLink5Description: https://datasheet.ciiva.com/22673/1678782-22673916.pdf?src-supplier=Element14; ComponentLink6URL: https://datasheet.ciiva.com/28532/1678782-28532109.pdf?src-supplier=Element14; ComponentLink6Description: https://datasheet.ciiva.com/28532/1678782-28532109.pdf?src-supplier=Element14; ComponentLink7URL: https://datasheet.ciiva.com/16767/70260748-16767559.pdf?src-supplier=Allied+Electronics; ComponentLink7Description: https://datasheet.ciiva.com/16767/70260748-16767559.pdf?src-supplier=Allied+Electronics; ComponentLink8URL: https://datasheet.ciiva.com/9198/aoa0000ce2-9198920.pdf?src-supplier=Avnet; ComponentLink8Description: https://datasheet.ciiva.com/9198/aoa0000ce2-9198920.pdf?src-supplier=Avnet; ComponentLink9URL: https://datasheet.ciiva.com/16771/70260748-16771979.pdf?src-supplier=Allied+Electronics; ComponentLink9Description: https://datasheet.ciiva.com/16771/70260748-16771979.pdf?src-supplier=Allied+Electronics
T5 T6 T9 T10 = BSC080N03LSG: MOSFET N-CH 30V 53A TDSON-8; Manufacturer 1: Infineon; Rds On Max: 8mR; Input Capacitance: 1.7nF; Rise Time: 2.8ns; Max Power Dissipation: 35W; Power Dissipation: 2.5W; Gate to Source Voltage (Vgs): 20V; Fall Time: 2.6ns; Turn-Off Delay Time: 15ns; Threshold Voltage: 2.2V; Turn-On Delay Time: 3.3ns; Element Configuration: Single; Supplier 1: Digi-Key; Manufacturer Part Number 1: BSC080N03LSG; Stock 1: 16105; Pricing 1: 1=0,70000, 10=0,61600, 100=0,42020, 500=0,35108, 1000=0,29878 (USD); RoHS: Yes; Number of Pins: 8; Min Operating Temperature: -55°C; Max Operating Temperature: 150°C; Packaging: Tape and Reel; Drain to Source Voltage (Vdss): 30V; Continuous Drain Current (ID): 53A; Package Quantity: 1; Drain to Source Breakdown Voltage: 30V; Drain to Source Resistance: 8mR; Length: 6.35mm; Height: 1.1mm; Width: 5.35mm; Halogen Free: Halogen Free; REACH SVHC: No SVHC; ComponentLink1URL: https://datasheet.ciiva.com/1189/infineon-bsc080n03ls-ds-v02-01-en-1189645.pdf?src-supplier=Element14; ComponentLink1Description: https://datasheet.ciiva.com/1189/infineon-bsc080n03ls-ds-v02-01-en-1189645.pdf?src-supplier=Element14; ComponentLink2URL: https://datasheet.ciiva.com/26789/bsc080n03ls-g-26789476.pdf?src-supplier=IIIC; ComponentLink2Description: https://datasheet.ciiva.com/26789/bsc080n03ls-g-26789476.pdf?src-supplier=IIIC
T7 T8 T11 T12 = BSC030N03LS-G: MOSFET, N CH, 100A, 30V, PG-TDSON-8; Manufacturer 1: Infineon; Rise Time: 5.2ns; Rds On Max: 3mR; Input Capacitance: 4.3nF; Fall Time: 4.8ns; Power Dissipation: 2.5W; Turn-Off Delay Time: 29ns; Max Power Dissipation: 69W; Turn-On Delay Time: 7.3ns; Number of Elements: 1; Gate to Source Voltage (Vgs): 20V; Threshold Voltage: 1V; Drain to Source Resistance: 4.7mR; Element Configuration: Single; RoHS: Yes; Case/Package: TO-252-3; Number of Pins: 8; Contact Plating: Tin; Min Operating Temperature: -55°C; Max Operating Temperature: 150°C; Packaging: Tape and Reel; Continuous Drain Current (ID): 100A; Package Quantity: 5000; Drain to Source Breakdown Voltage: 30V; Length: 5.35mm; Height: 1.1mm; Width: 6.35mm; Radiation Hardening: No; Halogen Free: Halogen Free; Lead Free: Lead Free; REACH SVHC: No SVHC; ComponentLink1URL: https://datasheet.ciiva.com/26896/getdatasheetpartid-635090-26896521.pdf?src-supplier=Verical; ComponentLink1Description: https://datasheet.ciiva.com/26896/getdatasheetpartid-635090-26896521.pdf?src-supplier=Verical; ComponentLink2URL: https://datasheet.ciiva.com/26790/bsc030n03ls-g-26790009.pdf?src-supplier=IIIC; ComponentLink2Description: https://datasheet.ciiva.com/26790/bsc030n03ls-g-26790009.pdf?src-supplier=IIIC; ComponentLink3URL: https://datasheet.ciiva.com/6368/bsc030n03ls-rev1-27-6368951.pdf?src-supplier=Digi-Key; ComponentLink3Description: https://datasheet.ciiva.com/6368/bsc030n03ls-rev1-27-6368951.pdf?src-supplier=Digi-Key; ComponentLink4URL: https://datasheet.ciiva.com/6368/bsc030n03ls-rev1-27-6368952.pdf?src-supplier=Digi-Key; ComponentLink4Description: https://datasheet.ciiva.com/6368/bsc030n03ls-rev1-27-6368952.pdf?src-supplier=Digi-Key; ComponentLink5URL: https://datasheet.ciiva.com/11172/bsc030n03ls-rev1-27-11172568.pdf?src-supplier=Avnet; ComponentLink5Description: https://datasheet.ciiva.com/11172/bsc030n03ls-rev1-27-11172568.pdf?src-supplier=Avnet; ComponentLink6URL: https://datasheet.ciiva.com/11172/bsc030n03ls-rev1-27-11172569.pdf?src-supplier=Avnet; ComponentLink6Description: https://datasheet.ciiva.com/11172/bsc030n03ls-rev1-27-11172569.pdf?src-supplier=Avnet; ComponentLink7URL: https://datasheet.ciiva.com/6368/bsc030n03ls-rev1-27-6368954.pdf?src-supplier=Digi-Key; ComponentLink7Description: https://datasheet.ciiva.com/6368/bsc030n03ls-rev1-27-6368954.pdf?src-supplier=Digi-Key; Supplier 1: Digi-Key; Manufacturer Part Number 1: BSC030N03LS-G; Stock 1: 0
U34 = ADP1850ACPZ-R7: Analog Devices; Number of Outputs: 2; Output Voltage: 18V; Output Current: 25A; Max Supply Voltage: 20V; Min Supply Voltage: 2.75V; Switching Frequency: 1.5MHz; Max Duty Cycle: 90%; Synchronous Rectifier: Yes; Nominal Supply Current: 4.5mA; Max Output Current: 30A; Operating Supply Current: 100uA; Output Configuration: Positive; Supplier 1: Digi-Key; Manufacturer 1: Analog Devices; Manufacturer Part Number 1: ADP1850ACPZ-R7; Stock 1: 1022; Pricing 1: 1=4,61000, 10=4,14300, 25=3,91640, 100=3,39440, 250=3,22028, 500=2,88956 (USD); RoHS: Yes; Case/Package: LFCSP EP; Number of Pins: 32; Contact Plating: Tin,Matte; Min Operating Temperature: -40°C; Max Operating Temperature: 85°C; Packaging: Tape and Reel; Number of Output Phases: 2; Clock Sync: Yes; Max Input Voltage: 20V; Min Input Voltage: 2.75V; Radiation Hardening: No; REACH SVHC: No SVHC; Lead Free: Contains Lead; ComponentLink1URL: https://datasheet.ciiva.com/3217/adp1850-3217744.pdf?src-supplier=Avnet; ComponentLink1Description: https://datasheet.ciiva.com/3217/adp1850-3217744.pdf?src-supplier=Avnet; ComponentLink2URL: https://datasheet.ciiva.com/8306/adp1850-8306183.pdf?src-supplier=Avnet; ComponentLink2Description: https://datasheet.ciiva.com/8306/adp1850-8306183.pdf?src-supplier=Avnet; ComponentLink3URL: https://datasheet.ciiva.com/2015/adp1850-2015067.pdf?src-supplier=Digi-Key; ComponentLink3Description: https://datasheet.ciiva.com/2015/adp1850-2015067.pdf?src-supplier=Digi-Key; ComponentLink4URL: https://datasheet.ciiva.com/17297/adp1850-17297115.pdf?src-supplier=Avnet+Europe; ComponentLink4Description: https://datasheet.ciiva.com/17297/adp1850-17297115.pdf?src-supplier=Avnet+Europe; ComponentLink5URL: https://datasheet.ciiva.com/2015/adp1850-2015068.pdf?src-supplier=Digi-Key; ComponentLink5Description: https://datasheet.ciiva.com/2015/adp1850-2015068.pdf?src-supplier=Digi-Key; ComponentLink6URL: https://datasheet.ciiva.com/2015/adp1850-2015069.pdf?src-supplier=Digi-Key; ComponentLink6Description: https://datasheet.ciiva.com/2015/adp1850-2015069.pdf?src-supplier=Digi-Key

## Sheet Power_ADP1850_Dual.SchDoc: Power_ADP1850_Dual
size A3; Organization: Altium Limited; Address1: L3, 12a Rodborough Rd; Address2: Frenchs Forest; Address3: NSW; Address4: Australia 2086
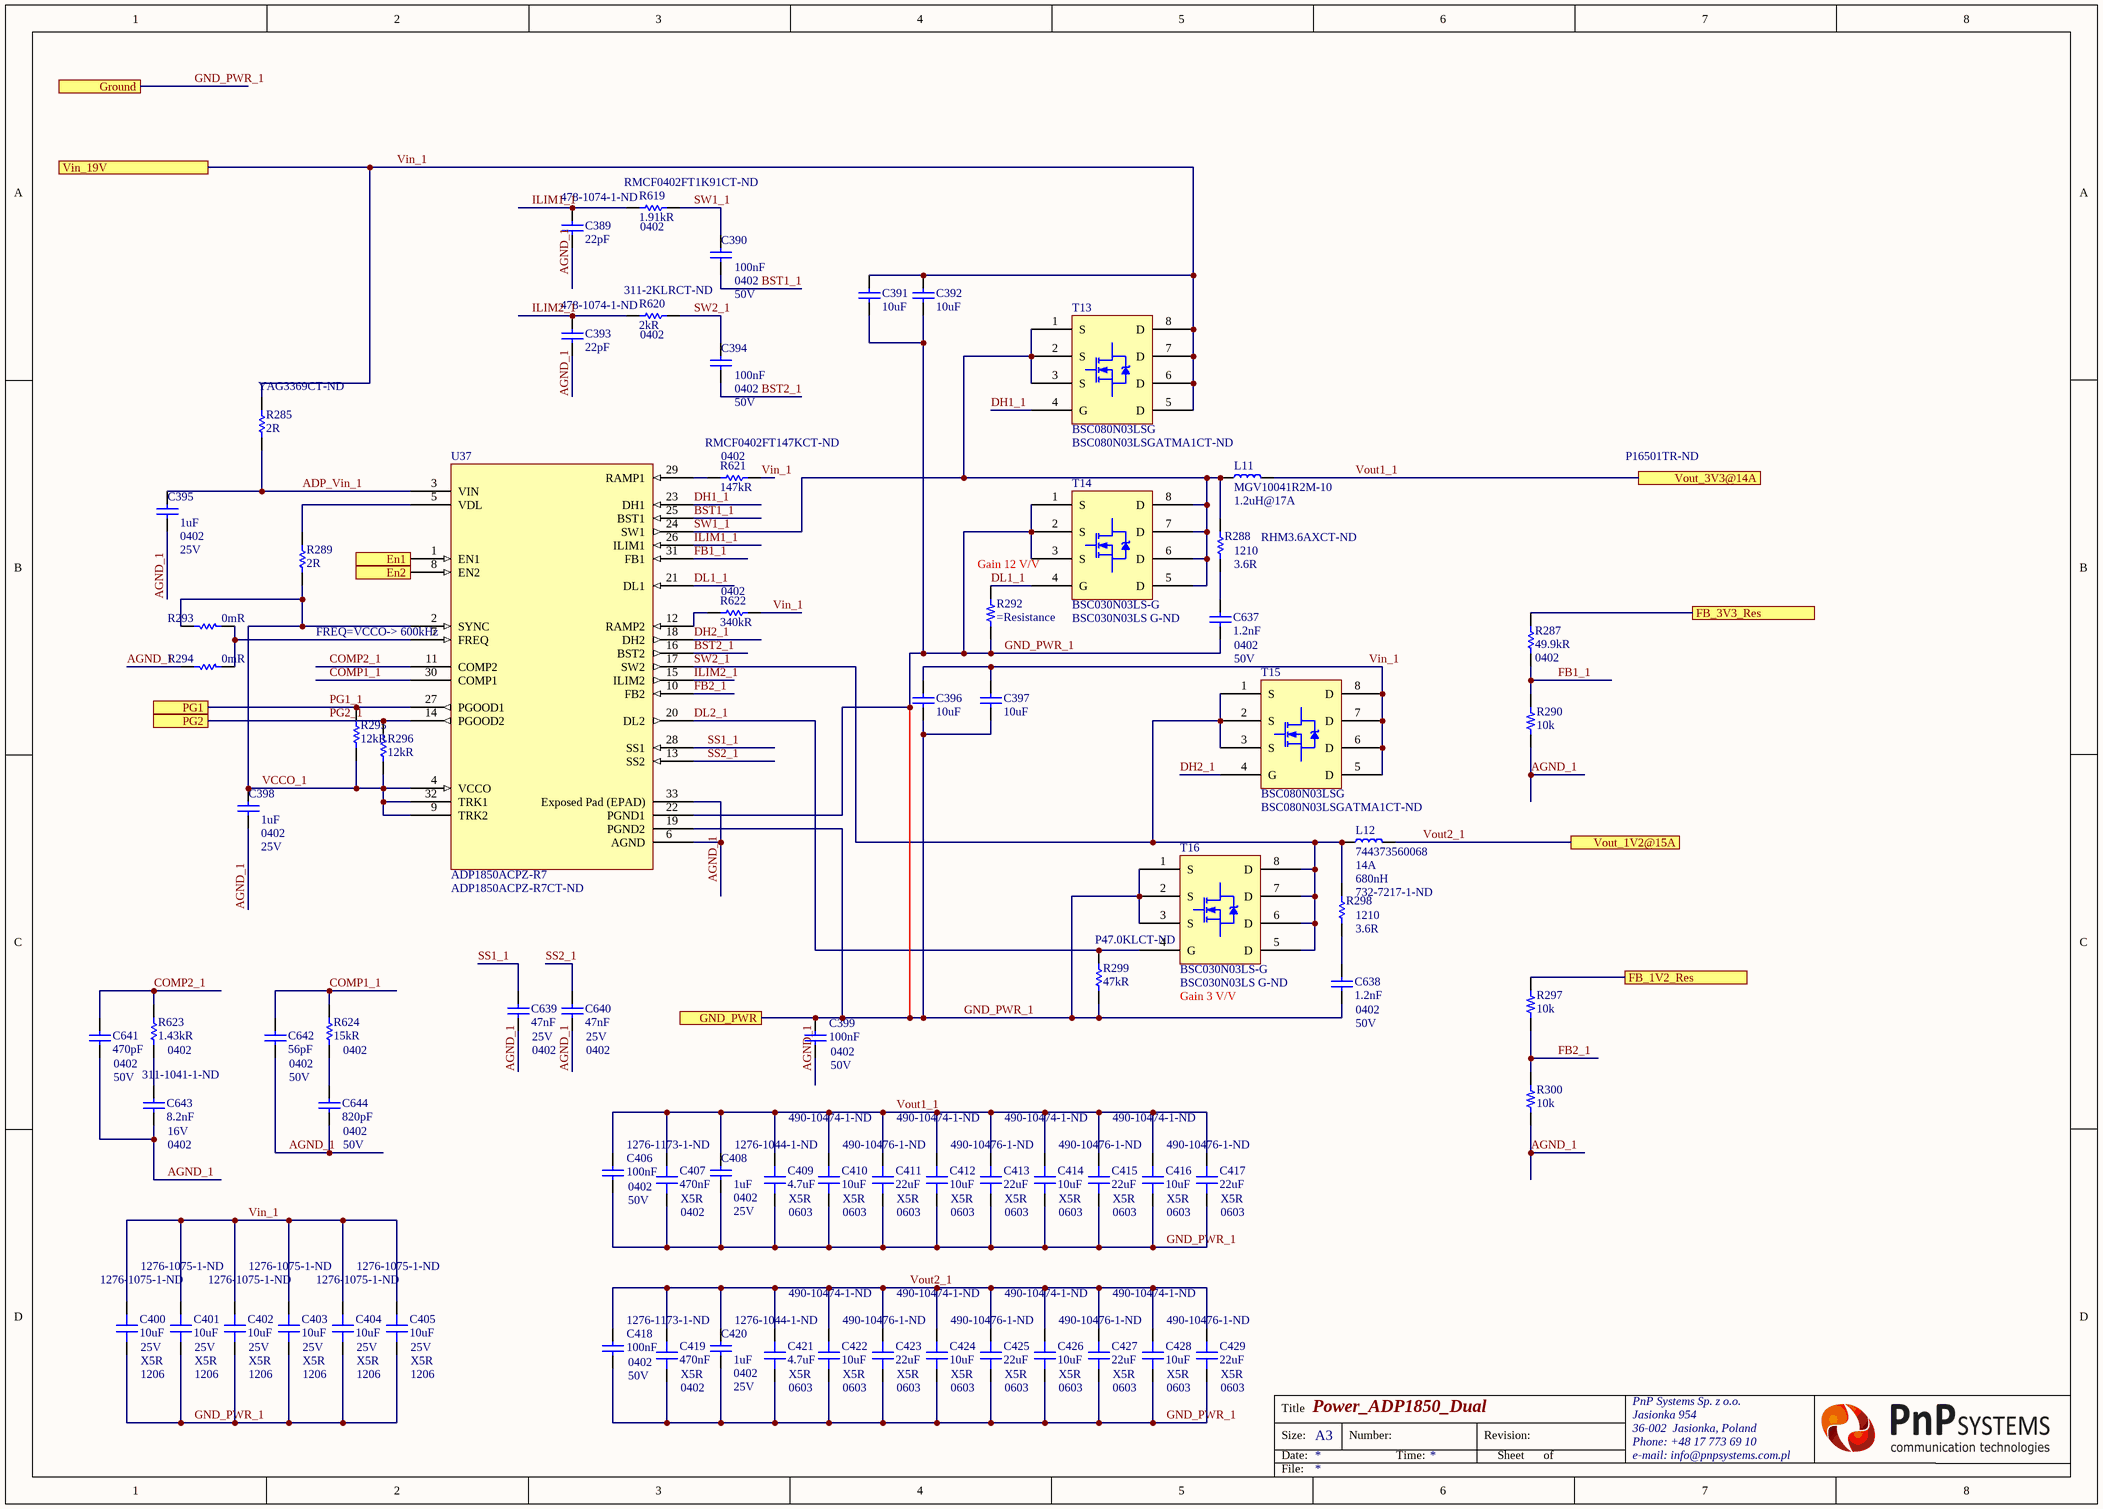
[diagram p24: Power_ADP1850_Dual.SchDoc]